# Altium schematic sheet SIM.A7682S.SchDoc: HMS.SIM.A7682S
size A2; Time: 2026.11.06
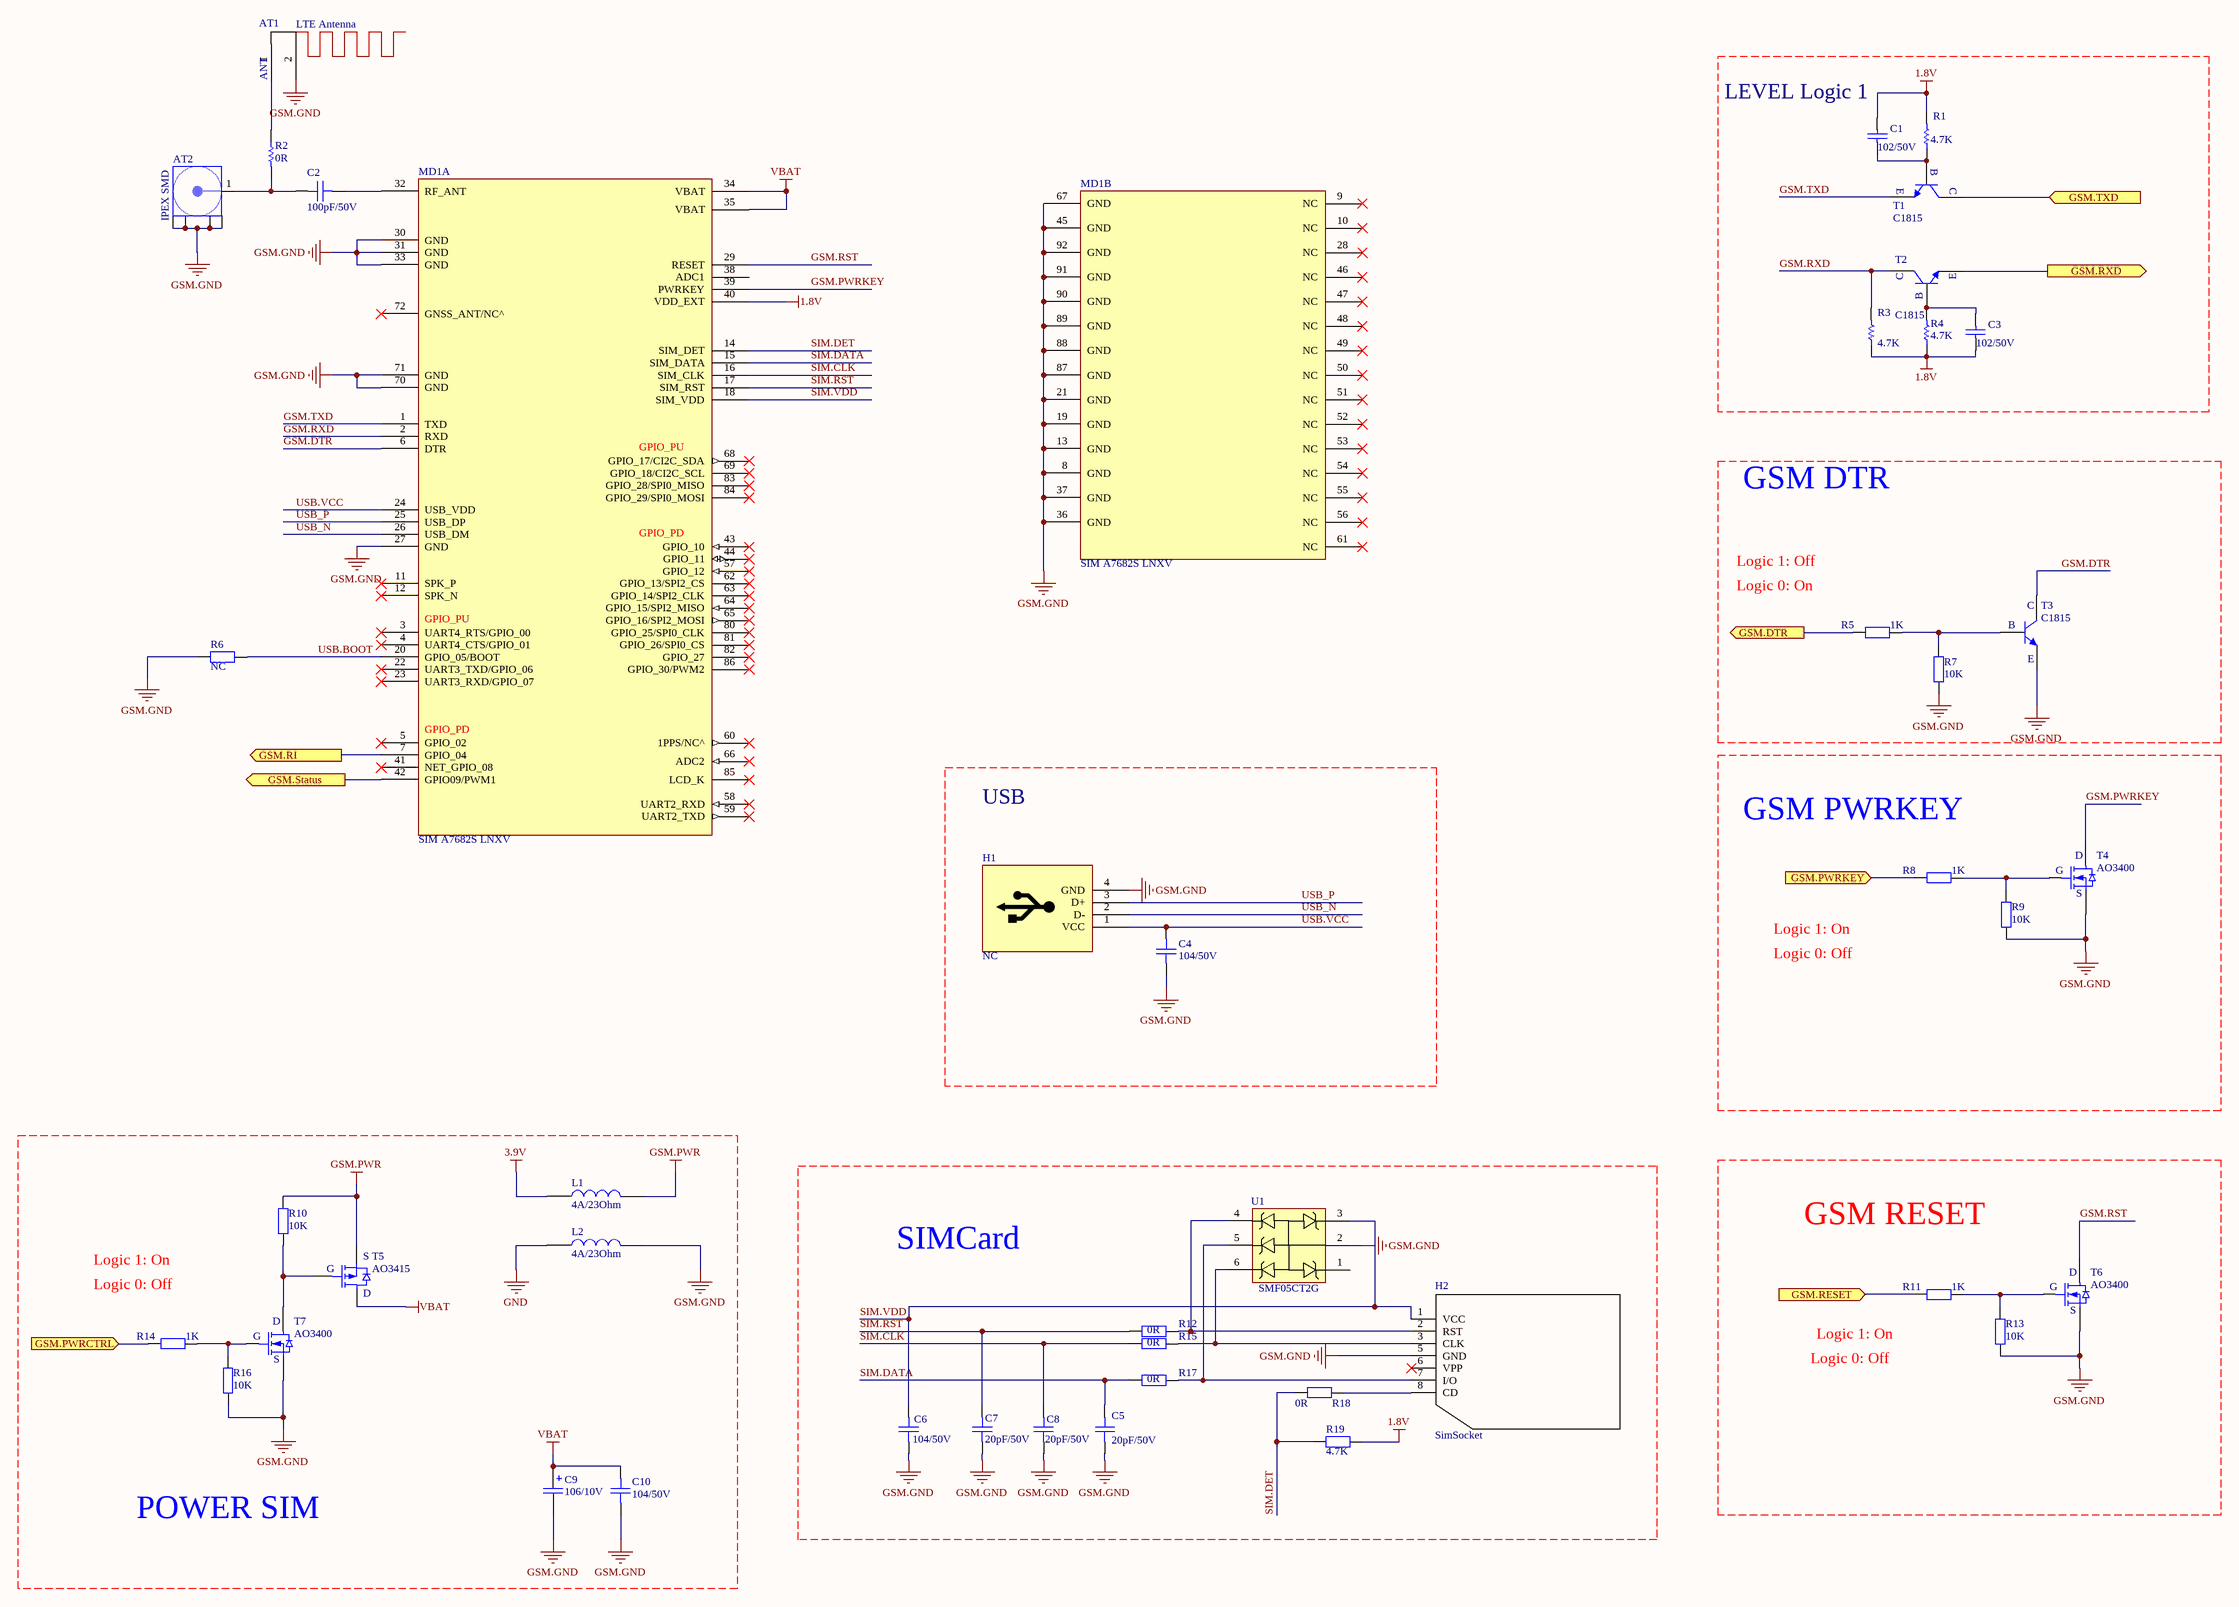
[diagram p0: SIM.A7682S.SchDoc]

## Parts
AT1  LTE Antenna  [Antenna LTE/4G PCB]
AT2  IPEX SMD  [IPEX SMD]
C1  102/50V  [CAP_CERAMIC_0402(1005)]
C2  100pF/50V  [CAP_CERAMIC_0402(1005)]
C3  102/50V  [CAP_CERAMIC_0402(1005)]
C4  104/50V  [CAP_CERAMIC_0402(1005)]
C5  20pF/50V  [CAP_CERAMIC_0402(1005)]
C6  104/50V  [CAP_CERAMIC_0402(1005)]
C7  20pF/50V  [CAP_CERAMIC_0402(1005)]
C8  20pF/50V  [CAP_CERAMIC_0402(1005)]
C9  106/10V  [CAP_TANTAL_2312(6032-28)]
C10  104/50V  [CAP_CERAMIC_0402(1005)]
H1  NC  [HDR1X4]
H2  SimSocket  [MUP-C7801]
L1  4A/23Ohm  [RES_0603(1608)]
L2  4A/23Ohm  [RES_0603(1608)]
MD1  SIM A7682S LNXV  [SIM A7682S]  (parts A,B of 2)
R1  4.7K  [RES_0402(1005)]
R2  value 0R  [RES_0402(1005)]  (hidden comment: NC)
R3  4.7K  [RES_0402(1005)]
R4  4.7K  [RES_0402(1005)]
R5  1K  [RES_0402(1005)]
R6  NC  [RES_0402(1005)]
R7  10K  [RES_0402(1005)]
R8  1K  [RES_0402(1005)]
R9  10K  [RES_0402(1005)]
R10  10K  [RES_0402(1005)]
R11  1K  [RES_0402(1005)]
R12  0R  [RES_0402(1005)]
R13  10K  [RES_0402(1005)]
R14  1K  [RES_0402(1005)]
R15  0R  [RES_0402(1005)]
R16  10K  [RES_0402(1005)]
R17  0R  [RES_0402(1005)]
R18  0R  [RES_0402(1005)]
R19  4.7K  [RES_0402(1005)]
T1  C1815  [SOT23-3]
T2  C1815  [SOT23-3]
T3  C1815  [SOT23-3]
T4  AO3400  [SOT23-3]
T5  AO3415  [SOT23-3]
T6  AO3400  [SOT23-3]
T7  AO3400  [SOT23-3]
U1  SMF05CT2G  [SOT65P210X140-6N]

## Ports
GSM.DTR (out), GSM.PWRCTRL (in), GSM.PWRKEY (in), GSM.RESET (in), GSM.RI (out), GSM.RXD (out), GSM.Status (out), GSM.TXD (in)

## Nets
1.8V: C1.2 C3.1 MD1.40(VDD_EXT) R1.2 R3.1 R4.1 R19.2
3.9V: L1.1
GND: L2.1
GSM.GND: AT1.2 AT2.2 C4.1 C5.2 C6.1 C7.2 C8.2 C9.2 C10.1 H1.4(GND) H2.5(GND) L2.2 MD1.8(GND) MD1.13(GND) MD1.19(GND) MD1.21(GND) MD1.27(GND) MD1.30(GND) MD1.31(GND) MD1.33(GND) MD1.36(GND) MD1.37(GND) MD1.45(GND) MD1.67(GND) MD1.70(GND) MD1.71(GND) MD1.87(GND) MD1.88(GND) MD1.89(GND) MD1.90(GND) MD1.91(GND) MD1.92(GND) R6.1 R7.1 R9.1 R13.1 R16.1 T3.2 T4.2 T6.2 T7.2 U1.2(AN)
GSM.PWR: L1.2 R10.2 T5.2(S)
VBAT: C9.1 C10.2 MD1.34(VBAT) MD1.35(VBAT) T5.3(D)
GSM.DTR: MD1.6(DTR) T3.3
GSM.DTR: R5.2 ; port GSM.DTR  [a separate net that carries the same name]
GSM.PWRCTRL: R14.2 ; port GSM.PWRCTRL
GSM.PWRKEY: MD1.39(PWRKEY) T4.3
GSM.PWRKEY: R8.2 ; port GSM.PWRKEY  [a separate net that carries the same name]
GSM.RESET: R11.2 ; port GSM.RESET
GSM.RI: MD1.7(GPIO_04) ; port GSM.RI
GSM.RST: MD1.29(RESET) T6.3
GSM.RXD: MD1.2(RXD) R3.2 T2.3
GSM.RXD: T2.2 ; port GSM.RXD  [a separate net that carries the same name]
GSM.Status: MD1.42(GPIO09/PWM1) ; port GSM.Status
GSM.TXD: MD1.1(TXD) T1.2
GSM.TXD: T1.3 ; port GSM.TXD  [a separate net that carries the same name]
SIM.CLK: C8.1 MD1.16(SIM_CLK) R15.1
SIM.DATA: C5.1 MD1.15(SIM_DATA) R17.1
SIM.DET: MD1.14(SIM_DET) R18.1 R19.1
SIM.RST: C7.1 MD1.17(SIM_RST) R12.1
SIM.VDD: C6.2 H2.1(VCC) MD1.18(SIM_VDD) U1.3(CT2)
USB.BOOT: MD1.20(GPIO_05/BOOT) R6.2
USB.VCC: C4.2 H1.1(VCC) MD1.24(USB_VDD)
USB_N: H1.2(D-) MD1.26(USB_DM)
USB_P: H1.3(D+) MD1.25(USB_DP)
NetAT1_1: AT1.1 R2.1
NetAT2_1: AT2.1(Signal) C2.2 R2.2
NetC1_1: C1.1 R1.1 T1.1
NetC2_1: C2.1 MD1.32(RF_ANT)
NetC3_2: C3.2 R4.2 T2.1
NetH2_2: H2.2(RST) R12.2 U1.4(CT3)
NetH2_3: H2.3(CLK) R15.2 U1.6(CT5)
NetH2_7: H2.7(I/O) R17.2 U1.5(CT4)
NetH2_8: H2.8(CD) R18.2
NetR5_1: R5.1 R7.2 T3.1
NetR8_1: R8.1 R9.2 T4.1
NetR10_1: R10.1 T5.1(G) T7.3
NetR11_1: R11.1 R13.2 T6.1
NetR14_1: R14.1 R16.2 T7.1

Not connected (* = marked no-connect by the designer): H2 6(VPP)*; MD1 3(UART4_RTS/GPIO_00)* 4(UART4_CTS/GPIO_01)* 5(GPIO_02)* 9(NC)* 10(NC)* 11(SPK_P)* 12(SPK_N)* 22(UART3_TXD/GPIO_06)* 23(UART3_RXD/GPIO_07)* 28(NC)* 38(ADC1) 41(NET_GPIO_08)* 43(GPIO_10)* 44(GPIO_11)* 46(NC)* 47(NC)* 48(NC)* 49(NC)* 50(NC)* 51(NC)* 52(NC)* 53(NC)* 54(NC)* 55(NC)* 56(NC)* 57(GPIO_12)* 58(UART2_RXD)* 59(UART2_TXD)* 60(1PPS/NC^)* 61(NC)* 62(GPIO_13/SPI2_CS)* 63(GPIO_14/SPI2_CLK)* 64(GPIO_15/SPI2_MISO)* 65(GPIO_16/SPI2_MOSI)* 66(ADC2)* 68(GPIO_17/CI2C_SDA)* 69(GPIO_18/CI2C_SCL)* 72(GNSS_ANT/NC^)* 80(GPIO_25/SPI0_CLK)* 81(GPIO_26/SPI0_CS)* 82(GPIO_27)* 83(GPIO_28/SPI0_MISO)* 84(GPIO_29/SPI0_MOSI)* 85(LCD_K)* 86(GPIO_30/PWM2)*; U1 1(CT1)

## Notes on the sheet
- (near C1) LEVEL Logic 1
- GSM DTR
- Logic 1: Off
- Logic 0: On
- USB
- GSM PWRKEY
- Logic 1: On
- Logic 0: Off
- GSM RESET
- SIMCard
- (near R11) Logic 1: On
- POWER SIM
- Title
- Size:
- Date:
- File:
- A2
- Number:
- Time:
- Revision:
- Sheet
- of
- (in symbol 2N7002,215) D; G; S
- (in symbol 2SC1815-HF) C; B; E
- (in symbol Antenna GSM/LTE PCB) ANT
- (in symbol C18C5) B; E; C
- (in symbol SIM A7682S, part A) GPIO_PU; GPIO_PD

## Library data of the parts
AT1 = Antenna GSM/LTE PCB: MPN: NC; Value: LTE Antenna
AT2 = SNW_H11-L17-SMA: CONN RCPT IPEX 50Ω SMD; MPN: U.FL-R-SMT-1(80); MFR: Fieyuxin; Solder: HAND; Value: IPEX SMA
C1 C3 = Cap: CAP CER 1nF 50V X7R 0402; MFR: YAGEO; MPN: CC0402KRX7R9BB102; Published: 8-Jun-2000; LatestRevisionDate: 17-Jul-2002; LatestRevisionNote: Re-released for DXP Platform.; PackageReference: RAD-0.3; Publisher: Altium Limited; Value: 102/50V; Category: Ceramic Capacitors
C2 = CC0402FRNPO9BN101: CAP CER 100pF 50V NP0 0402; MPN: CC0402JRNPO9BN101; MFR: YAGEO; Category: Ceramic Capacitors; Value: 100pF/50V
C4 = C0603C102K5RACTU: CAP CER 100nF 50V X5R 0402; MPN: CC0402KRX5R9BB104; MFR: YAGEO; CompanyID: VT-00573; Solder: SMT; Value: 104/50V; Category: Ceramic Capacitors; Parameter 4: *
C5 C7 C8 = 0603N330J500CT: CAP CER 20pF 50V NP0 0402; MPN: CQ0402FRNPO9BN200; MFR: Vishay Vitramon; CompanyID: VT-01106; Solder: SMT; Value: 20pF/50V; Category: Ceramic Capacitors
C6 = C0603C104K5RACTU: CAP CER 100nF 50V X5R 0402; MPN: CC0402KRX5R9BB104; MFR: Vishay Vitramon; CompanyID: VT-00982; Solder: SMT; Value: 104/50V; Category: Ceramic Capacitors; Parameter 4: *
C9 = Cap Tantal 2312 (6032-28): CAP TANT 10uF ±10% 16V CASE-C-6032; MPN: TAJC106K016RNJ; Value: 106/10V
C10 = CC0402KRX5R9BB104: CAP CER 100nF 50V X5R 0402; MFR: YAGEO; MPN: CC0402KRX5R9BB104; Category: Ceramic Capacitors; Value: 104/50V
H1 = USB-A/RAF: Value: NC; MPN: NC
H2 = MUP-C7801: Nano Sim card Socket; MPN: MUP-C7801-2; MFR: OEM; Value: 6 Pin
L1 L2 = FBMJ1608HM230NTV: FERRITE BEAD 23Ω 0603 1LN; MFR: Taiyo Yuden; MPN: FBMJ1608HM230NT; Category: Ferrite Beads and Chips; Value: 4A/23Ohm
MD1 = SIM A7682S: SIMCOM A7682S LNXV No GPS; MPN: SIM A7682S LNXV; MFR: SIMCOM; Value: SIM A7682S LNXV
R1 R3 R4 = Res1: RES 4.7kΩ ±1% 62.5mW 0402; MPN: RC0402FR-074K7L; MFR: Vishay Dale; Published: 8-Jun-2000; LatestRevisionDate: 17-Jul-2002; LatestRevisionNote: Re-released for DXP Platform.; PackageReference: AXIAL-0.3; Publisher: Altium Limited; PackageDescription: Axial Device, Thru-Hole; 2 Leads; 0.3 in Pin Spacing; Value: 4.7K; Category: Chip Resistor - Surface Mount
R2 = Res1: Trở 10K 1/8W 1% 0603; MFR: YAGEO; MPN: RT0603DRD0710KL; Published: 8-Jun-2000; LatestRevisionDate: 17-Jul-2002; LatestRevisionNote: Re-released for DXP Platform.; PackageReference: AXIAL-0.3; Publisher: Altium Limited; PackageDescription: Axial Device, Thru-Hole; 2 Leads; 0.3 in Pin Spacing; Category: Chip Resistor - Surface Mount; Value1: NC
R5 R8 R11 R14 = RC0402JR-074K7P: RES 1kΩ ±5% 62.5mW 0402; MPN: RC0402JR-071KL; MFR: YAGEO; Category: Chip Resistor - Surface Mount; Value: 1K
R6 = RT0603BRD071KL: MPN: RC0402FR-131KL; MFR: YAGEO; Value: NC; Category: Chip Resistor - Surface Mount
R7 R9 R10 R13 R16 = RC0402JR-074K7P: RES 10kΩ ±5% 62.5mW 0402; MPN: RC0402JR-0710KL; MFR: YAGEO; Category: Chip Resistor - Surface Mount; Value: 10K
R12 R15 R17 = RC0402FR-131KL: RES 0Ω ±1% 62.5mW 0402; MPN: RC0402FR-070RL; MFR: YAGEO; Value: 0R; Category: Chip Resistor - Surface Mount
R18 = RC0402FR-070RL: RES 0 OHM JUMPER 1/16W 0402; MFR: YAGEO; MPN: RC0402FR-070RL; Category: Chip Resistor - Surface Mount; Value: 0R
R19 = RC0402JR-074K7P: RES SMD 4.7K OHM 5% 1/16W 0402; MFR: YAGEO; Category: Chip Resistor - Surface Mount; MPN: RC0402JR-074K7P; Value: 4.7K
T1 T2 = C18C5: Trans C1815 NPN 0.15A/50V SMD SOT-23; MPN: 2SC1815; MFR: LinhKienChatLuong; Category: Transistor NPN; Value: C1815
T3 = 2SC1815-HF: Trans C1815 NPN 0.15A/50V SMD SOT23; MFR: LinhKienChatLuong; Parameter 2: Transistor NPN; MPN: 2SC1815; Value: C1815
T4 T6 = 2N7002,215: MOSFET N-CH 30V 4A SOT-23; MFR: Discrete Semiconductor Products; MPN: AO3400; Category: Mosfet N-Channel; Value: AO3400
T5 = A03415: MOSFET N-CH 20V 4A SOT-23; MPN: AO3415; Category: Transistor PNP; Value: AO3415
T7 = 2N7002,215: MOSFET N-CH 30V 4A SOT-23; MFR: Discrete Semiconductor Products; Value: 30V 4A; MPN: AO3400; Category: Mosfet N-Channel
U1 = SMF05C: Diode Zener 6-TSSOP; MFR: ON SEMICONDUCTOR; Solder: SMT; CompanyID: VT-0; ComponentLink1URL: http://www.onsemi.com/pub/Collateral/SMF05C-D.PDF; ComponentLink1Description: http://www.onsemi.com/pub/Collateral/SMF05C-D.PDF; Value: SMF05CT2G; MPN: SMF05CT2G; Category: IC